# Altium schematic sheet Sheet1V1.SchDoc: RFR Electronics New Member Project
size B; Revision: 2; SheetNumber: 2; SheetTotal: 2
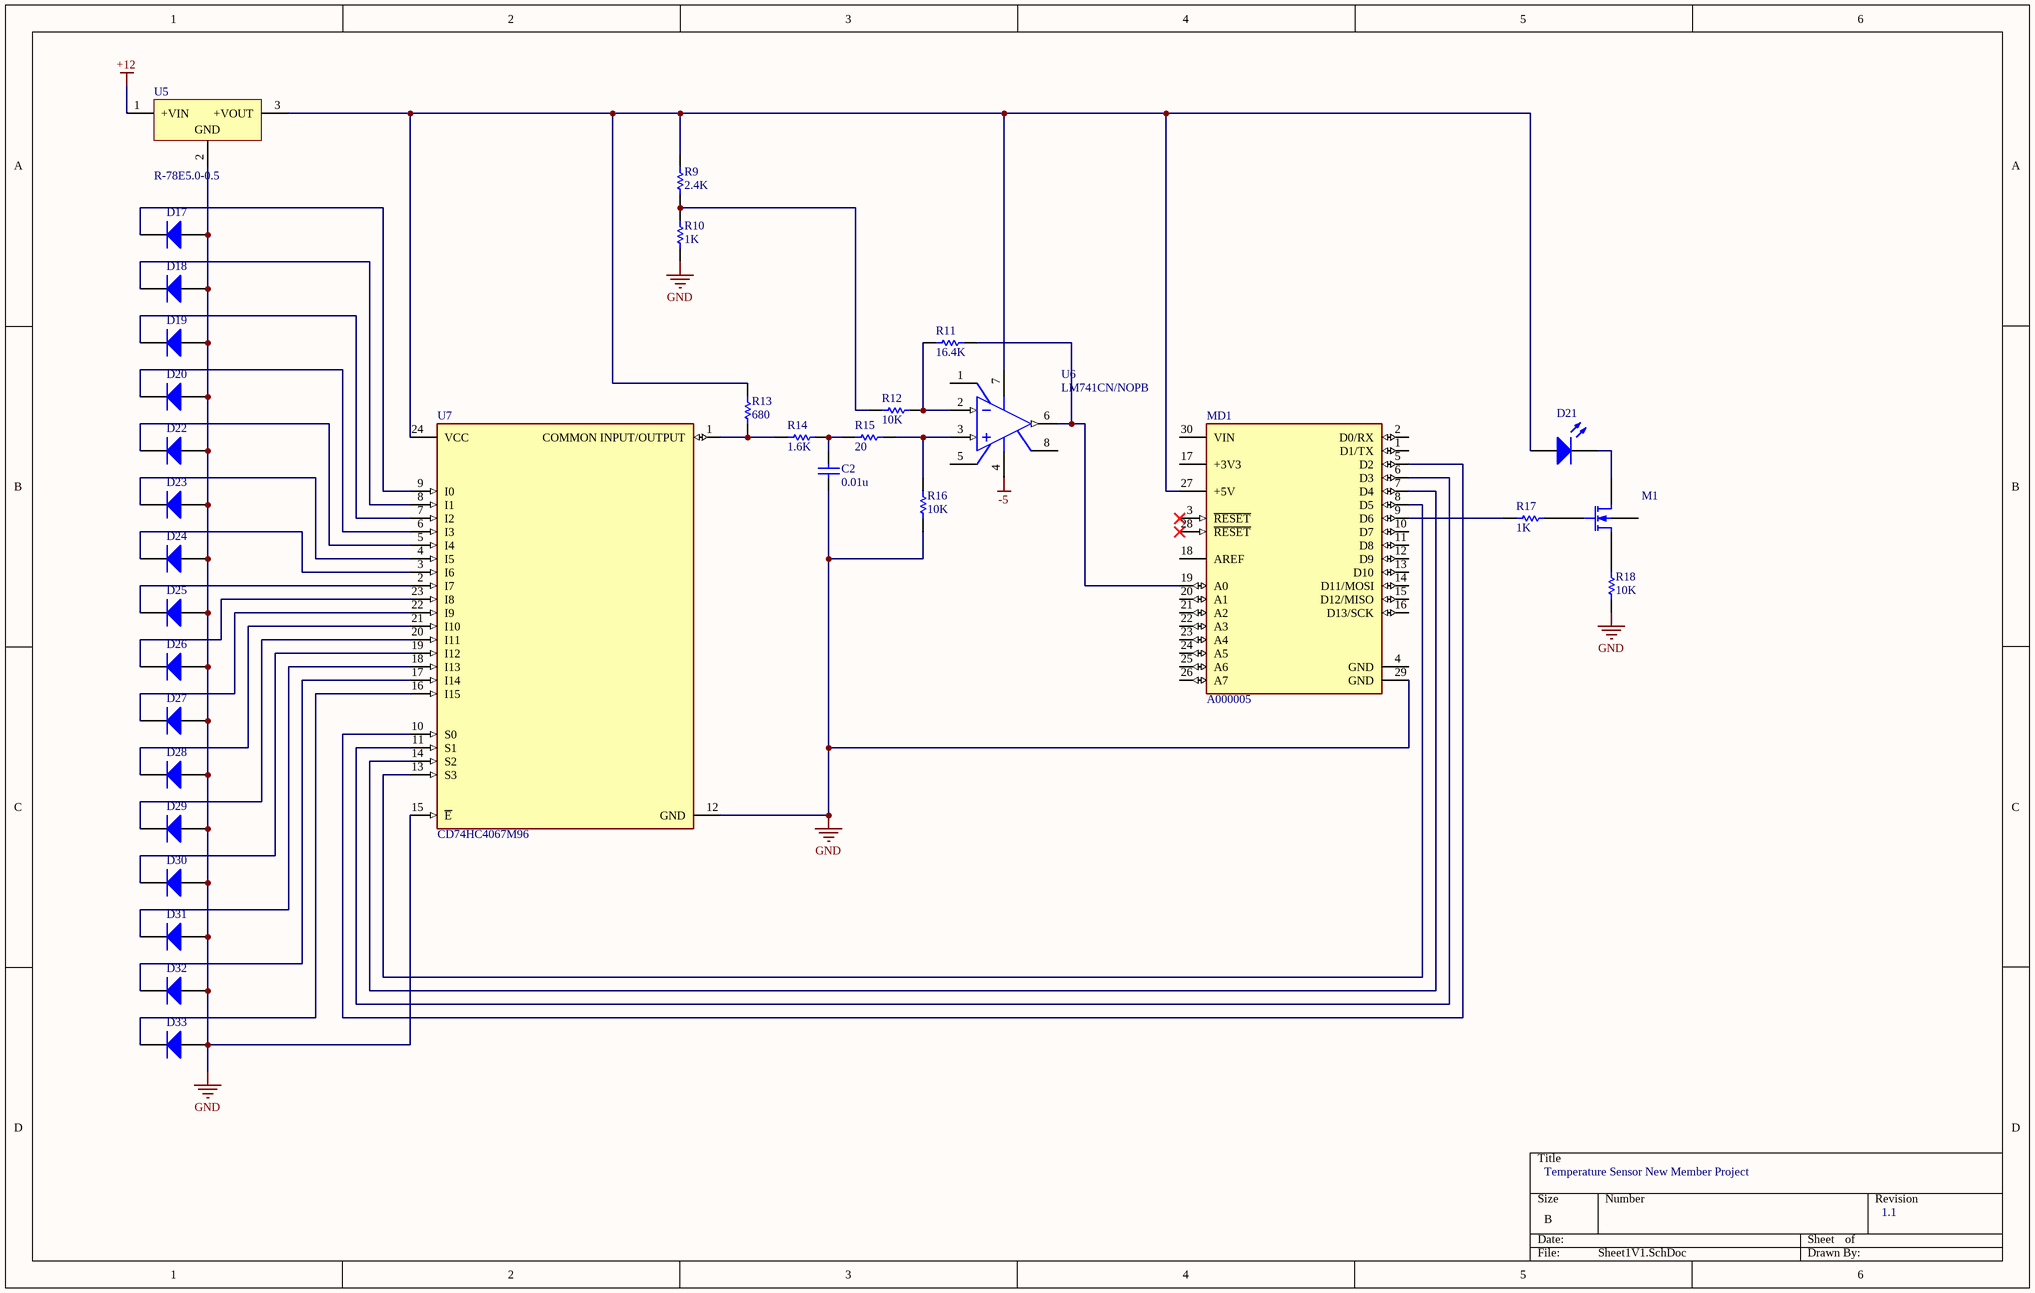
[diagram p0: Sheet1V1.SchDoc]

## Parts
C2  value 0.01u  (hidden comment: Capacitor)
D17  Diode  (value not drawn)
D18  Diode  (value not drawn)
D19  Diode  (value not drawn)
D20  Diode  (value not drawn)
D21  Light-Emitting Diode  (value not drawn)
D22  Diode  (value not drawn)
D23  Diode  (value not drawn)
D24  Diode  (value not drawn)
D25  Diode  (value not drawn)
D26  Diode  (value not drawn)
D27  Diode  (value not drawn)
D28  Diode  (value not drawn)
D29  Diode  (value not drawn)
D30  Diode  (value not drawn)
D31  Diode  (value not drawn)
D32  Diode  (value not drawn)
D33  Diode  (value not drawn)
M1  N-channel MOS1 MOSFET Shichman and Hodges Model  (value not drawn)
MD1  A000005  [FP-A000005-MFG]
R9  value 2.4K  (hidden comment: Resistor)
R10  value 1K  (hidden comment: Resistor)
R11  value 16.4K  (hidden comment: Resistor)
R12  value 10K  (hidden comment: Resistor)
R13  value 680  (hidden comment: Resistor)
R14  value 1.6K  (hidden comment: Resistor)
R15  value 20  (hidden comment: Resistor)
R16  value 10K  (hidden comment: Resistor)
R17  value 1K  (hidden comment: Resistor)
R18  value 10K  (hidden comment: Resistor)
U5  R-78E5.0-0.5  [REPO-R-78E-0.5-3_V]
U6  LM741CN/NOPB  [P0008A]
U7  CD74HC4067M96  [FP-DW0024A-MFG]

## Nets
+12: U5.1(+VIN)
-5: U6.4(V-)
GND: C2.1 D17.1(A) D18.1(A) D19.1(A) D20.1(A) D22.1(A) D23.1(A) D24.1(A) D25.1(A) D26.1(A) D27.1(A) D28.1(A) D29.1(A) D30.1(A) D31.1(A) D32.1(A) D33.1(A) MD1.29(GND) R10.1 R16.1 R18.1 U5.2(GND) U7.12(GND) U7.15(~{E})
NetC2_2: C2.2 R14.2 R15.1
NetD17_2: D17.2(K) U7.9(I0)
NetD18_2: D18.2(K) U7.8(I1)
NetD19_2: D19.2(K) U7.7(I2)
NetD20_2: D20.2(K) U7.6(I3)
NetD21_1: D21.1(A) MD1.27(+5V) R9.2 R13.2 U5.3(+VOUT) U6.7(V+) U7.24(VCC)
NetD21_2: D21.2(K) M1.1(D)
NetD22_2: D22.2(K) U7.5(I4)
NetD23_2: D23.2(K) U7.4(I5)
NetD24_2: D24.2(K) U7.3(I6)
NetD25_2: D25.2(K) U7.2(I7)
NetD26_2: D26.2(K) U7.23(I8)
NetD27_2: D27.2(K) U7.22(I9)
NetD28_2: D28.2(K) U7.21(I10)
NetD29_2: D29.2(K) U7.20(I11)
NetD30_2: D30.2(K) U7.19(I12)
NetD31_2: D31.2(K) U7.18(I13)
NetD32_2: D32.2(K) U7.17(I14)
NetD33_2: D33.2(K) U7.16(I15)
NetM1_2: M1.2(G) R17.2
NetM1_3: M1.3(S) R18.2
NetMD1_5: MD1.5(D2) U7.10(S0)
NetMD1_6: MD1.6(D3) U7.11(S1)
NetMD1_7: MD1.7(D4) U7.14(S2)
NetMD1_8: MD1.8(D5) U7.13(S3)
NetMD1_9: MD1.9(D6) R17.1
NetMD1_19: MD1.19(A0) R11.2 U6.6(OUT)
NetR9_1: R9.1 R10.2 R12.1
NetR11_1: R11.1 R12.2 U6.2(IN-)
NetR13_1: R13.1 R14.1 U7.1(COMMON_INPUT/OUTPUT)
NetR15_2: R15.2 R16.2 U6.3(IN+)

Not connected (* = marked no-connect by the designer): M1 4(B); MD1 1(D1/TX) 2(D0/RX) 3(~{RESET})* 4(GND) 10(D7) 11(D8) 12(D9) 13(D10) 14(D11/MOSI) 15(D12/MISO) 16(D13/SCK) 17(+3V3) 18(AREF) 20(A1) 21(A2) 22(A3) 23(A4) 24(A5) 25(A6) 26(A7) 28(~{RESET})* 30(VIN); U6 1(OFS_NULL) 5(OFS_NULL) 8(NC)

## Notes on the sheet
- Temperature Sensor New Member Project
- 1.1

## Library data of the parts
C2 = Capacitor: SimulationGenericComponent: True
D17-D20 D22-D33 = Diode: AF: 1; BV: 0; BV_MAX: 1e99; EG: 1.11; FC: 0.5; IBV: 0.001; ISR: 1e-14; MJSW: 0.33; NTUN: 30; TNOM: 27; XTI: 3; SimulationGenericComponent: True; CJO: 0; CJP: 0; CTA: 0; CTP: 0; FCS: 0.5; FV_MAX: 1e99; IKF: 0; IKR: 0; JSW: 0; JTUN: 0; JTUNSW: 0; KEG: 1; KF: 0; LEVEL: 1; N: 1; NBV: 1; NR: 1; NS: 1; PHP: 1; RS: 0; TCV: 0; TLEV: 0; TLEVC: 0; TM1: 0; TM2: 0; TPB: 0; TPHP: 0; TRS: 0; TRS2: 0; TT: 0; TTT1: 0; TTT2: 0; VJ: 1; XTITUN: 3; IS: 1e-14
D21 = LED: AF: 1; BV: 0; BV_MAX: 1e99; EG: 1.11; FC: 0.5; IBV: 0.001; IS: 1e-14; MJSW: 0.33; NTUN: 30; TNOM: 27; XTI: 3; SimulationGenericComponent: True; CJO: 0; CJP: 0; CTA: 0; CTP: 0; FCS: 0.5; FV_MAX: 1e99; IKF: 0; IKR: 0; ISR: 1e-14; JSW: 0; JTUN: 0; JTUNSW: 0; KEG: 1; KF: 0; LEVEL: 1; N: 1; NBV: 1; NR: 1; NS: 1; PHP: 1; RS: 0; TCV: 0; TLEV: 0; TLEVC: 0; TM1: 0; TM2: 0; TPB: 0; TPHP: 0; TRS: 0; TRS2: 0; TT: 0; TTT1: 0; TTT2: 0; VJ: 1; XTITUN: 3
M1 = MOSFET N-ch Lev1: CBD: 0; FC: 0.5; IS: 1e-14; KP: 2e-05; PB: 0.8; PHI: 0.6; TNOM: 27; SimulationGenericComponent: True; CBS: 0; CGBO: 0; CGDO: 0; CGSO: 0; CJ: 0; CJSW: 0; GAMMA: 0; JS: 0; LAMBDA: 0; LD: 0; MJ: 0.5; MJSW: 0.5; NSS: 0; NSUB: 0; RD: 0; RS: 0; RSH: 0; TOX: 0; TPG: 0; U0: 0; VTO: 0
MD1 = CMP-189986-000002-1: ARDUINO NANO ATMEGA328 EVAL BRD; Number of Bits: 8; Evaluation Kit: Yes; Operating Supply Voltage: 12V; Interface: I2C; Data Bus Width: 8b; Core Architecture: AVR; Packaging: Bulk; Length: 7inch; Package Quantity: 50; Width: 5inch; REACH SVHC: No SVHC; Weight: 0.358383oz; Series: AVR® ATmega; Height: 0.25inch
R9-R18 = Resistor: TC1: 0; SimulationGenericComponent: True; TC2: 0
U5 = CMP-2000-06922-2: DC/DC-Converter, 5 V Single Output, 500 mA, -40 to 85 degC, 3-Pin THD, RoHS, Tube; Manufacturer: Recom Power; Efficiency: 92%; Number of Outputs: 1; Current - Output (Max): 500mA; VIN Min: 7V; Package Version: Rev. 0; VIN Max: 28V; VOUT: 5V; Manufacturer URL: http://www.recom-power.com/us/americas/home.html; Operating Temperature: -40°C~85°C; Datasheet Version: 01/2017; Packaging: Tube; Package Reference: SIP Module; Datasheet URL: http://www.recom-power.com/pdf/Innoline/R-78Exx-0.5.pdf; Package Description: 3-Pin Through Hole Device, Body 11.6 x 8.5 mm, Pitch 2.54 mm; Mounting Technology: ThroughHole
U6 = CMP-0055-00162-3: Operational Amplifier, 8-pin MDIP, Pb-Free; Manufacturer: Texas Instruments; PackageTopMarking: NSUZXYTTE#*LM*741CN; PowerWise: N; CompType: Amplifiers; ComponentLink1Description: Datasheet URL; ComponentLink1URL: http://www.ti.com/general/docs/lit/getliterature.tsp?genericPartNumber=LM741&fileType=pdf; PackageDescription: MDIP, .365 x .250 x .130in, 8 Lead, .100in Pitch; RoHS: Y; PinCount: 8; Code_JEDEC: MS-001-BA; Package Reference: P0008A
U7 = CMP-04901-000007-1: IC MUX/DEMUX 1X16 24SOIC; Manufacturer: Texas Instruments; Standoff Height: 0.1mm; Logic Function Desc: Non-Inverting; Max Supply Voltage: 6V; Number Of Inputs: 16; Quiescent Current: 8uA; Number Of Circuits: 1; Propagation Delay: 6ns; Max Junction Temp: +150°C; Min Supply Voltage: 2V; ComponentLink2Description: Datasheet; Octopart: https://octopart.com/cd74hc4067m96-texas+instruments-722802; Ambient Temperature Range High: +125°C; Ipc Land Pattern Name: SOIC127P1030X265-24; Height: 2.65mm; Mouser Description: Multiplexer Switch ICs Hi-Spd CMOS 16Ch Anl Mltplxr/Demltplxr; Temperature Range Low: -55°C; Package: DW0024A; Temperature Range High: +125°C; Lead Free: Yes; ComponentLink2URL: http://www.ti.com/lit/ds/symlink/cd74hc4067.pdf; Manufacturer Part Number: CD74HC4067M96; RoHS: TRUE; Automotive: No; Device Class L1: Integrated Circuits (ICs); Digikey Description: IC MUX/DEMUX 1X16 24SOIC; Device Class L2: Logic ICs; Temperature: -55°C to +125°C; Device Class L3: Multiplexers; Category: IC; Ambient Temperature Range Low: -55°C; Number Of Outputs: 1